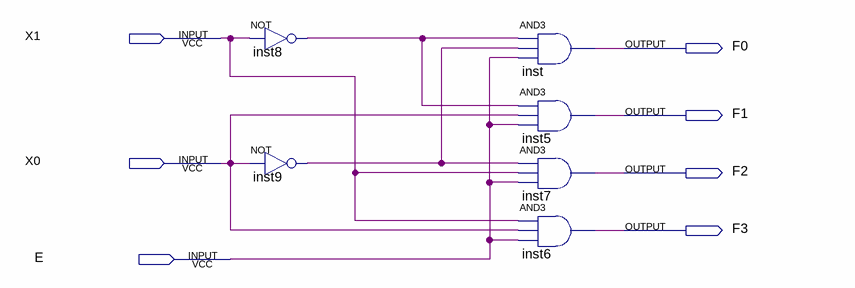
[diagram p0: schematic sheet]
// Quartus schematic DMX_2to4.bdf as structural Verilog: 6 symbols, 7 pins
module DMX_2to4 (
  input  X1,
  input  X0,
  input  E,
  output F0,
  output F1,
  output F2,
  output F3
);

  wire inst8_out, inst9_out;

  not inst8 (inst8_out, X1);
  not inst9 (inst9_out, X0);
  and inst (F0, inst8_out, inst9_out, E);
  and inst5 (F1, inst8_out, X0, E);
  and inst7 (F2, inst9_out, X1, E);
  and inst6 (F3, X1, X0, E);
endmodule
